# Altium schematic sheet Sheet3.SchDoc
size A3
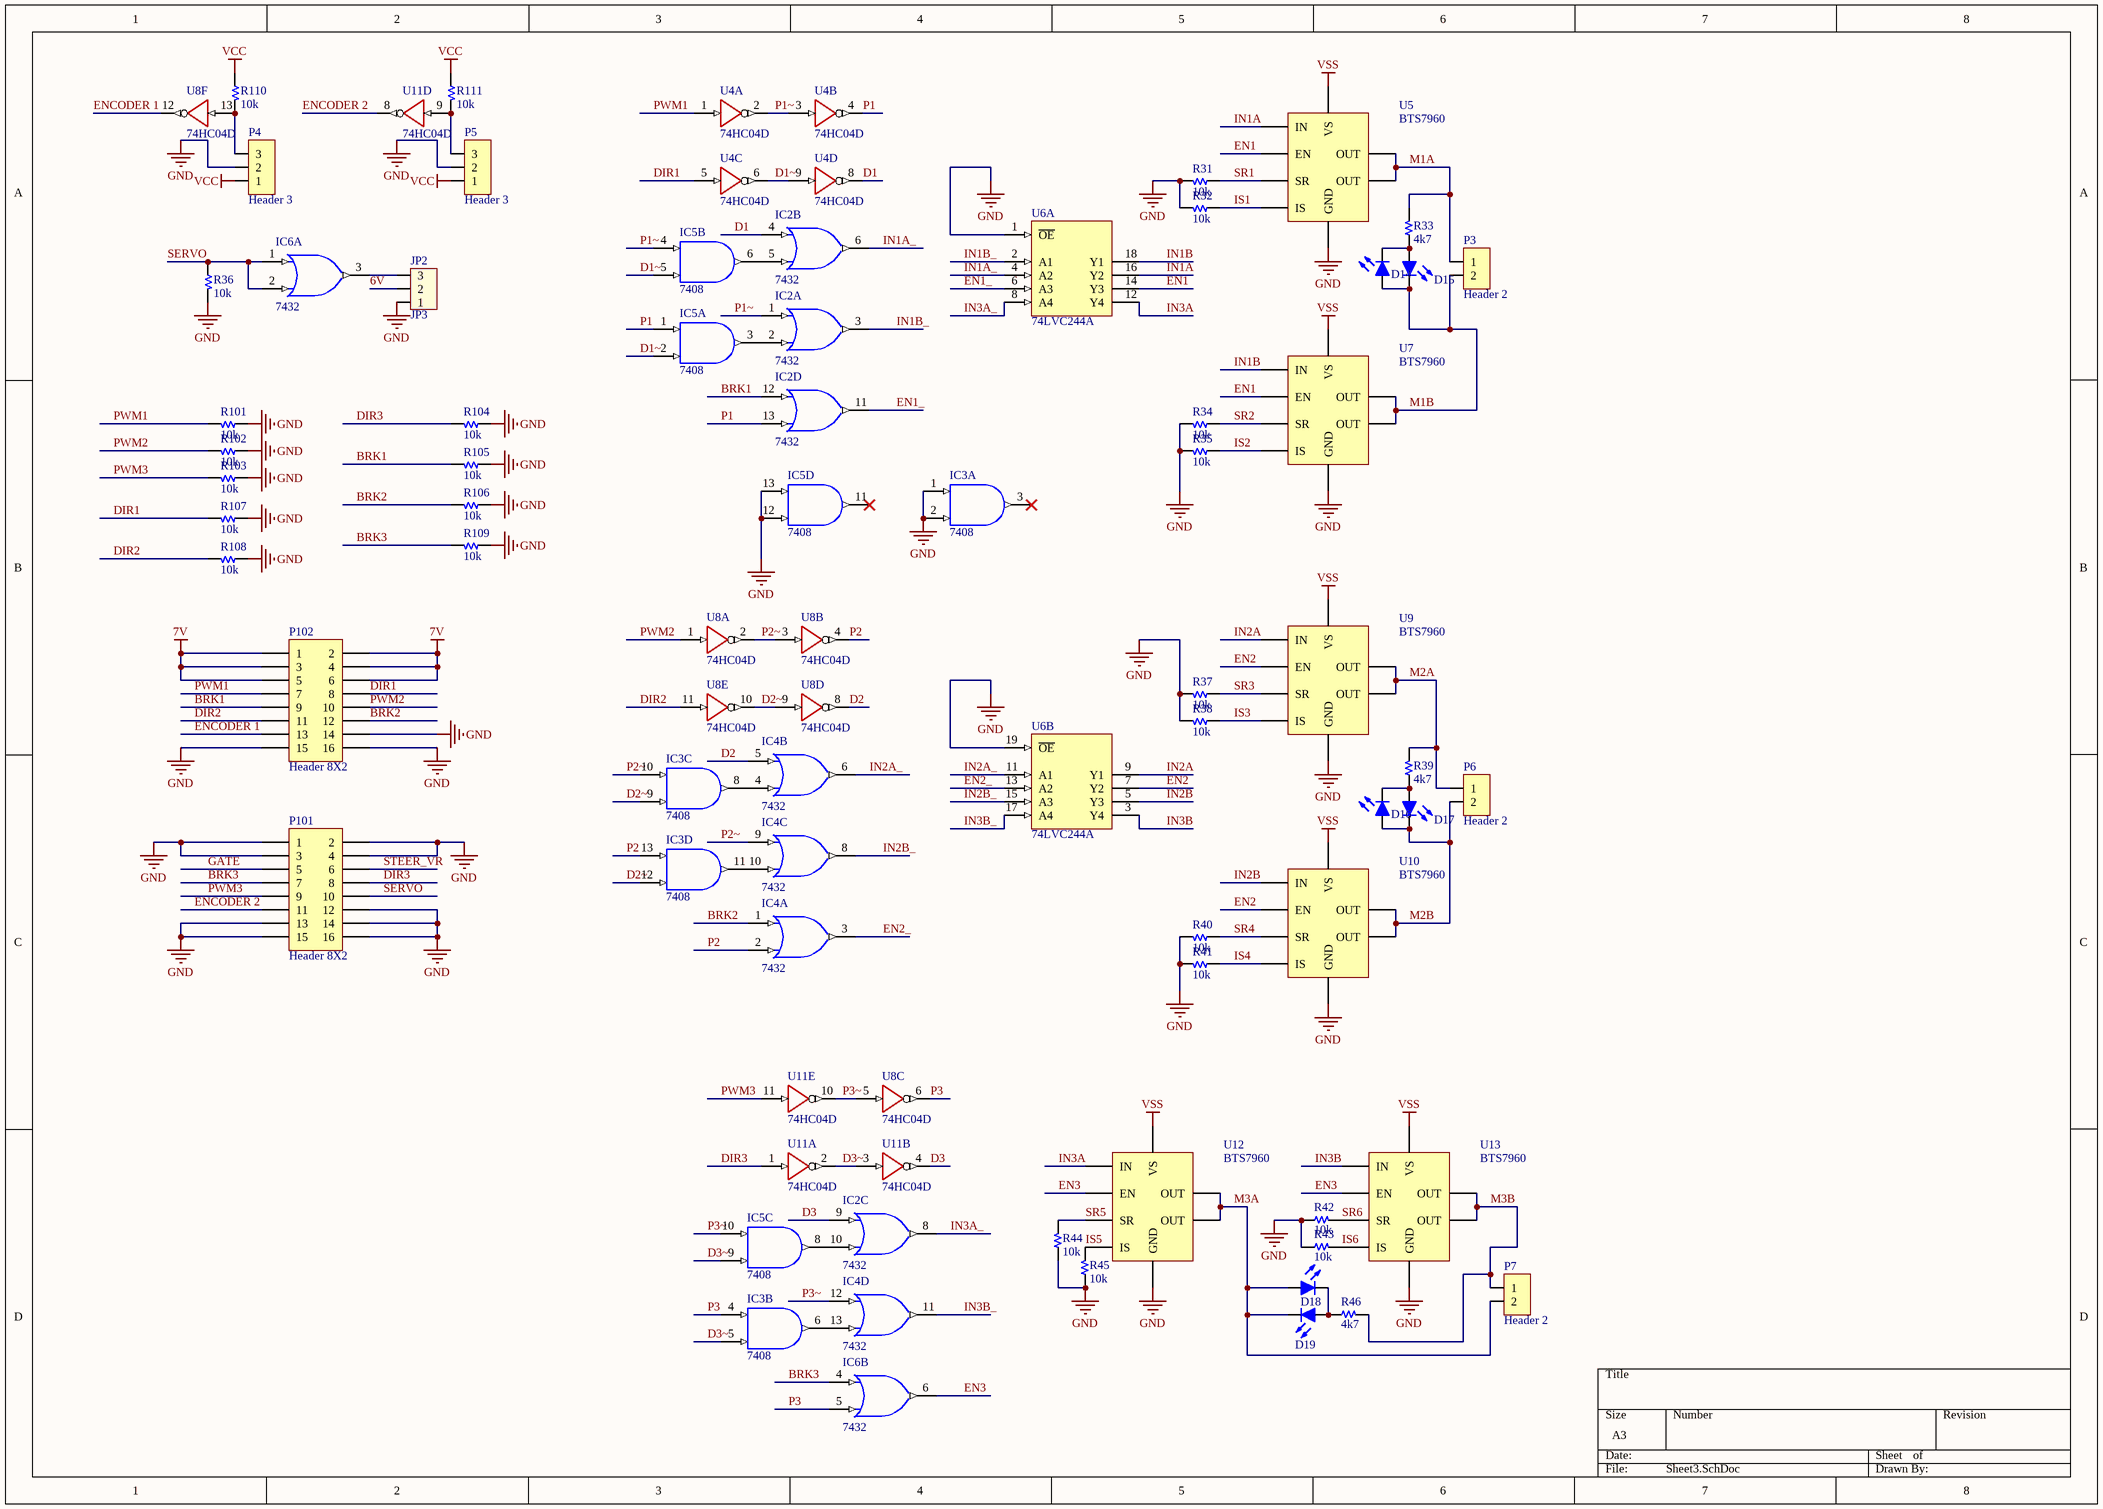
[diagram p0: Sheet3.SchDoc]

## Parts
D14  Led  [Led 0805 Green]  (value not drawn)
D15  Led  [Led 0805 Blue]  (value not drawn)
D16  Led  [Led 0805 Green]  (value not drawn)
D17  Led  [Led 0805 Blue]  (value not drawn)
D18  Led  [Led 0805 Green]  (value not drawn)
D19  Led  [Led 0805 Blue]  (value not drawn)
IC2  7432  [SOIC-14]  (parts A,B,C,D of 4)
IC3  7408  [SOIC-14]  (parts A,B,C,D of 4)
IC4  7432  [SOIC-14]  (parts A,B,C,D of 4)
IC5  7408  [SOIC-14]  (parts A,B,C,D of 4)
IC6  7432  [SOIC-14]  (parts A,B of 4)
JP2  JP3  [HDR/Header/3/BOX]
P3  Header 2  [HDR/Terminal/2/5mm]
P4  Header 3  [HDR/Header/3/BOX]
P5  Header 3  [HDR/Header/3/BOX]
P6  Header 2  [HDR/Terminal/2/5mm]
P7  Header 2  [HDR/Terminal/2/5mm]
P101  Header 8X2  [CON2X8N]
P102  Header 8X2  [CON2X8N]
R31  10k  [R 0805]
R32  10k  [R 0805]
R33  4k7  [R 0805]
R34  10k  [R 0805]
R35  10k  [R 0805]
R36  10k  [R 0805]
R37  10k  [R 0805]
R38  10k  [R 0805]
R39  4k7  [R 0805]
R40  10k  [R 0805]
R41  10k  [R 0805]
R42  10k  [R 0805]
R43  10k  [R 0805]
R44  10k  [R 0805]
R45  10k  [R 0805]
R46  4k7  [R 0805]
R101  10k  [R 0805]
R102  10k  [R 0805]
R103  10k  [R 0805]
R104  10k  [R 0805]
R105  10k  [R 0805]
R106  10k  [R 0805]
R107  10k  [R 0805]
R108  10k  [R 0805]
R109  10k  [R 0805]
R110  10k  [R 0805]
R111  10k  [R 0805]
U4  74HC04D  [SOIC-14]  (parts A,B,C,D of 6)
U5  BTS7960  [BTS7960]
U6  74LVC244A  [SOIC20-W]  (parts A,B of 2)
U7  BTS7960  [BTS7960]
U8  74HC04D  [SOIC-14]  (parts A,B,C,D,E,F of 6)
U9  BTS7960  [BTS7960]
U10  BTS7960  [BTS7960]
U11  74HC04D  [SOIC-14]  (parts A,B,D,E of 6)
U12  BTS7960  [BTS7960]
U13  BTS7960  [BTS7960]

## Nets
7V: P102.1 P102.2 P102.3 P102.4 P102.5 P102.6
GND: IC2.7(GND) IC3.1(A) IC3.2(B) IC3.7(GND) IC4.7(GND) IC5.7(GND) IC5.12(B) IC5.13(A) IC6.7(GND) JP2.1 P4.2 P5.2 P101.1 P101.2 P101.3 P101.4 P101.12 P101.13 P101.14 P101.15 P101.16 P102.14 P102.15 P102.16 R31.2 R32.2 R34.2 R35.2 R36.2 R37.2 R38.2 R40.2 R41.2 R42.1 R43.1 R44.1 R45.1 R101.1 R102.1 R103.1 R104.1 R105.1 R106.1 R107.1 R108.1 R109.1 U4.7(GND) U5.1(GND) U6.1(~{OE}) U6.10(GND) U6.19(~{OE}) U7.1(GND) U8.7(GND) U9.1(GND) U10.1(GND) U11.7(GND) U12.1(GND) U13.1(GND)
VCC: IC2.14(VCC) IC3.14(VCC) IC4.14(VCC) IC5.14(VCC) IC6.14(VCC) P4.1 P5.1 R110.1 R111.1 U4.14(VCC) U6.20(VCC) U8.14(VCC) U11.14(VCC)
VSS: U5.7(VS) U7.7(VS) U9.7(VS) U10.7(VS) U12.7(VS) U13.7(VS)
6V: JP2.2
BRK1: IC2.12(A) P102.9 R105.2
BRK2: IC4.1(A) P102.12 R106.2
BRK3: IC6.4(A) P101.7 R109.2
D1: IC2.4(A) U4.8(Y4)
D1~: IC5.2(B) IC5.5(B) U4.6(Y3) U4.9(A4)
D2: IC4.5(B) U8.8(Y4)
D2~: IC3.9(B) IC3.12(B) U8.9(A4) U8.10(Y5)
D3: IC2.9(A) U11.4(Y2)
D3~: IC3.5(B) IC5.9(B) U11.2(Y1) U11.3(A2)
DIR1: P102.8 R107.2 U4.5(A3)
DIR2: P102.11 R108.2 U8.11(A5)
DIR3: P101.8 R104.2 U11.1(A1)
EN1: U5.3(EN) U6.14(Y3) U7.3(EN)
EN1_: IC2.11(Y) U6.6(A3)
EN2: U6.7(Y2) U9.3(EN) U10.3(EN)
EN2_: IC4.3(Y) U6.13(A2)
EN3: IC6.6(Y) U12.3(EN) U13.3(EN)
ENCODER 1: P102.13 U8.12(Y6)
ENCODER 2: P101.11 U11.8(Y4)
GATE: P101.5
IN1A: U5.2(IN) U6.16(Y2)
IN1A_: IC2.6(Y) U6.4(A2)
IN1B: U6.18(Y1) U7.2(IN)
IN1B_: IC2.3(Y) U6.2(A1)
IN2A: U6.9(Y1) U9.2(IN)
IN2A_: IC4.6(Y) U6.11(A1)
IN2B: U6.5(Y3) U10.2(IN)
IN2B_: IC4.8(Y) U6.15(A3)
IN3A: U6.12(Y4) U12.2(IN)
IN3A_: IC2.8(Y) U6.8(A4)
IN3B: U6.3(Y4) U13.2(IN)
IN3B_: IC4.11(Y) U6.17(A4)
IS1: R32.1 U5.6(IS)
IS2: R35.1 U7.6(IS)
IS3: R38.1 U9.6(IS)
IS4: R41.1 U10.6(IS)
IS5: R45.2 U12.6(IS)
IS6: R43.2 U13.6(IS)
M1A: P3.1 R33.2 U5.4(OUT) U5.8(OUT)
M1B: D14.1(A) D15.2(K) P3.2 U7.4(OUT) U7.8(OUT)
M2A: P6.1 R39.2 U9.4(OUT) U9.8(OUT)
M2B: D16.1(A) D17.2(K) P6.2 U10.4(OUT) U10.8(OUT)
M3A: D18.1(A) D19.2(K) P7.2 U12.4(OUT) U12.8(OUT)
M3B: P7.1 R46.2 U13.4(OUT) U13.8(OUT)
P1: IC2.13(B) IC5.1(A) U4.4(Y2)
P1~: IC2.1(A) IC5.4(A) U4.2(Y1) U4.3(A2)
P2: IC3.13(A) IC4.2(B) U8.4(Y2)
P2~: IC3.10(A) IC4.9(A) U8.2(Y1) U8.3(A2)
P3: IC3.4(A) IC6.5(B) U8.6(Y3)
P3~: IC4.12(A) IC5.10(A) U8.5(A3) U11.10(Y5)
PWM1: P102.7 R101.2 U4.1(A1)
PWM2: P102.10 R102.2 U8.1(A1)
PWM3: P101.9 R103.2 U11.11(A5)
SERVO: IC6.1(A) IC6.2(B) P101.10 R36.1
SR1: R31.1 U5.5(SR)
SR2: R34.1 U7.5(SR)
SR3: R37.1 U9.5(SR)
SR4: R40.1 U10.5(SR)
SR5: R44.2 U12.5(SR)
SR6: R42.2 U13.5(SR)
STEER_VR: P101.6
NetD14_2: D14.2(K) D15.1(A) R33.1
NetD16_2: D16.2(K) D17.1(A) R39.1
NetD18_2: D18.2(K) D19.1(A) R46.1
NetIC2_2: IC2.2(B) IC5.3(O)
NetIC2_5: IC2.5(B) IC5.6(O)
NetIC2_10: IC2.10(B) IC5.8(O)
NetIC3_6: IC3.6(O) IC4.13(B)
NetIC3_8: IC3.8(O) IC4.4(A)
NetIC3_11: IC3.11(O) IC4.10(B)
NetIC6_3: IC6.3(Y) JP2.3
NetP4_3: P4.3 R110.2 U8.13(A6)
NetP5_3: P5.3 R111.2 U11.9(A4)

Not connected (* = marked no-connect by the designer): IC3 3(O)*; IC5 11(O)*

## Library data of the parts
D14-D19 = Led: Typical LED
IC2 IC4 IC6 = 7432: Quad 2-Input OR Gate
IC3 IC5 = 7408: Quad 2-Input AND Gate; Value: 7408
JP2 = Con3: Connector 3; Value: Connector 3
P3 P6 P7 = Header 2: Header, 2-Pin
P4 P5 = Header 3: Header, 3-Pin
P101 P102 = Header 8X2: Header, 8-Pin, Dual row
R31-R46 R101-R111 = Resistor
U4 U8 U11 = 74HC04D: IC INVERTER HEX TTL/LSTTL 14SOIC
U6 = 74LVC244A: Octal Buffer/Driver with 3-State Outputs; Vendor: Digikey; Published: 5-Jan-2004; DatasheetDocument: Aug-2003; Publisher: Altium Limited; ComponentLink1Description: Digikey Part Link; ComponentLink2Description: Open Datasheet; ComponentLink2URL: H:\LIBRARY\LIBRARY.Datasheet\sn74LS244.pdf